# Altium schematic sheet 00_TOP_LEVEL.SchDoc
size A3
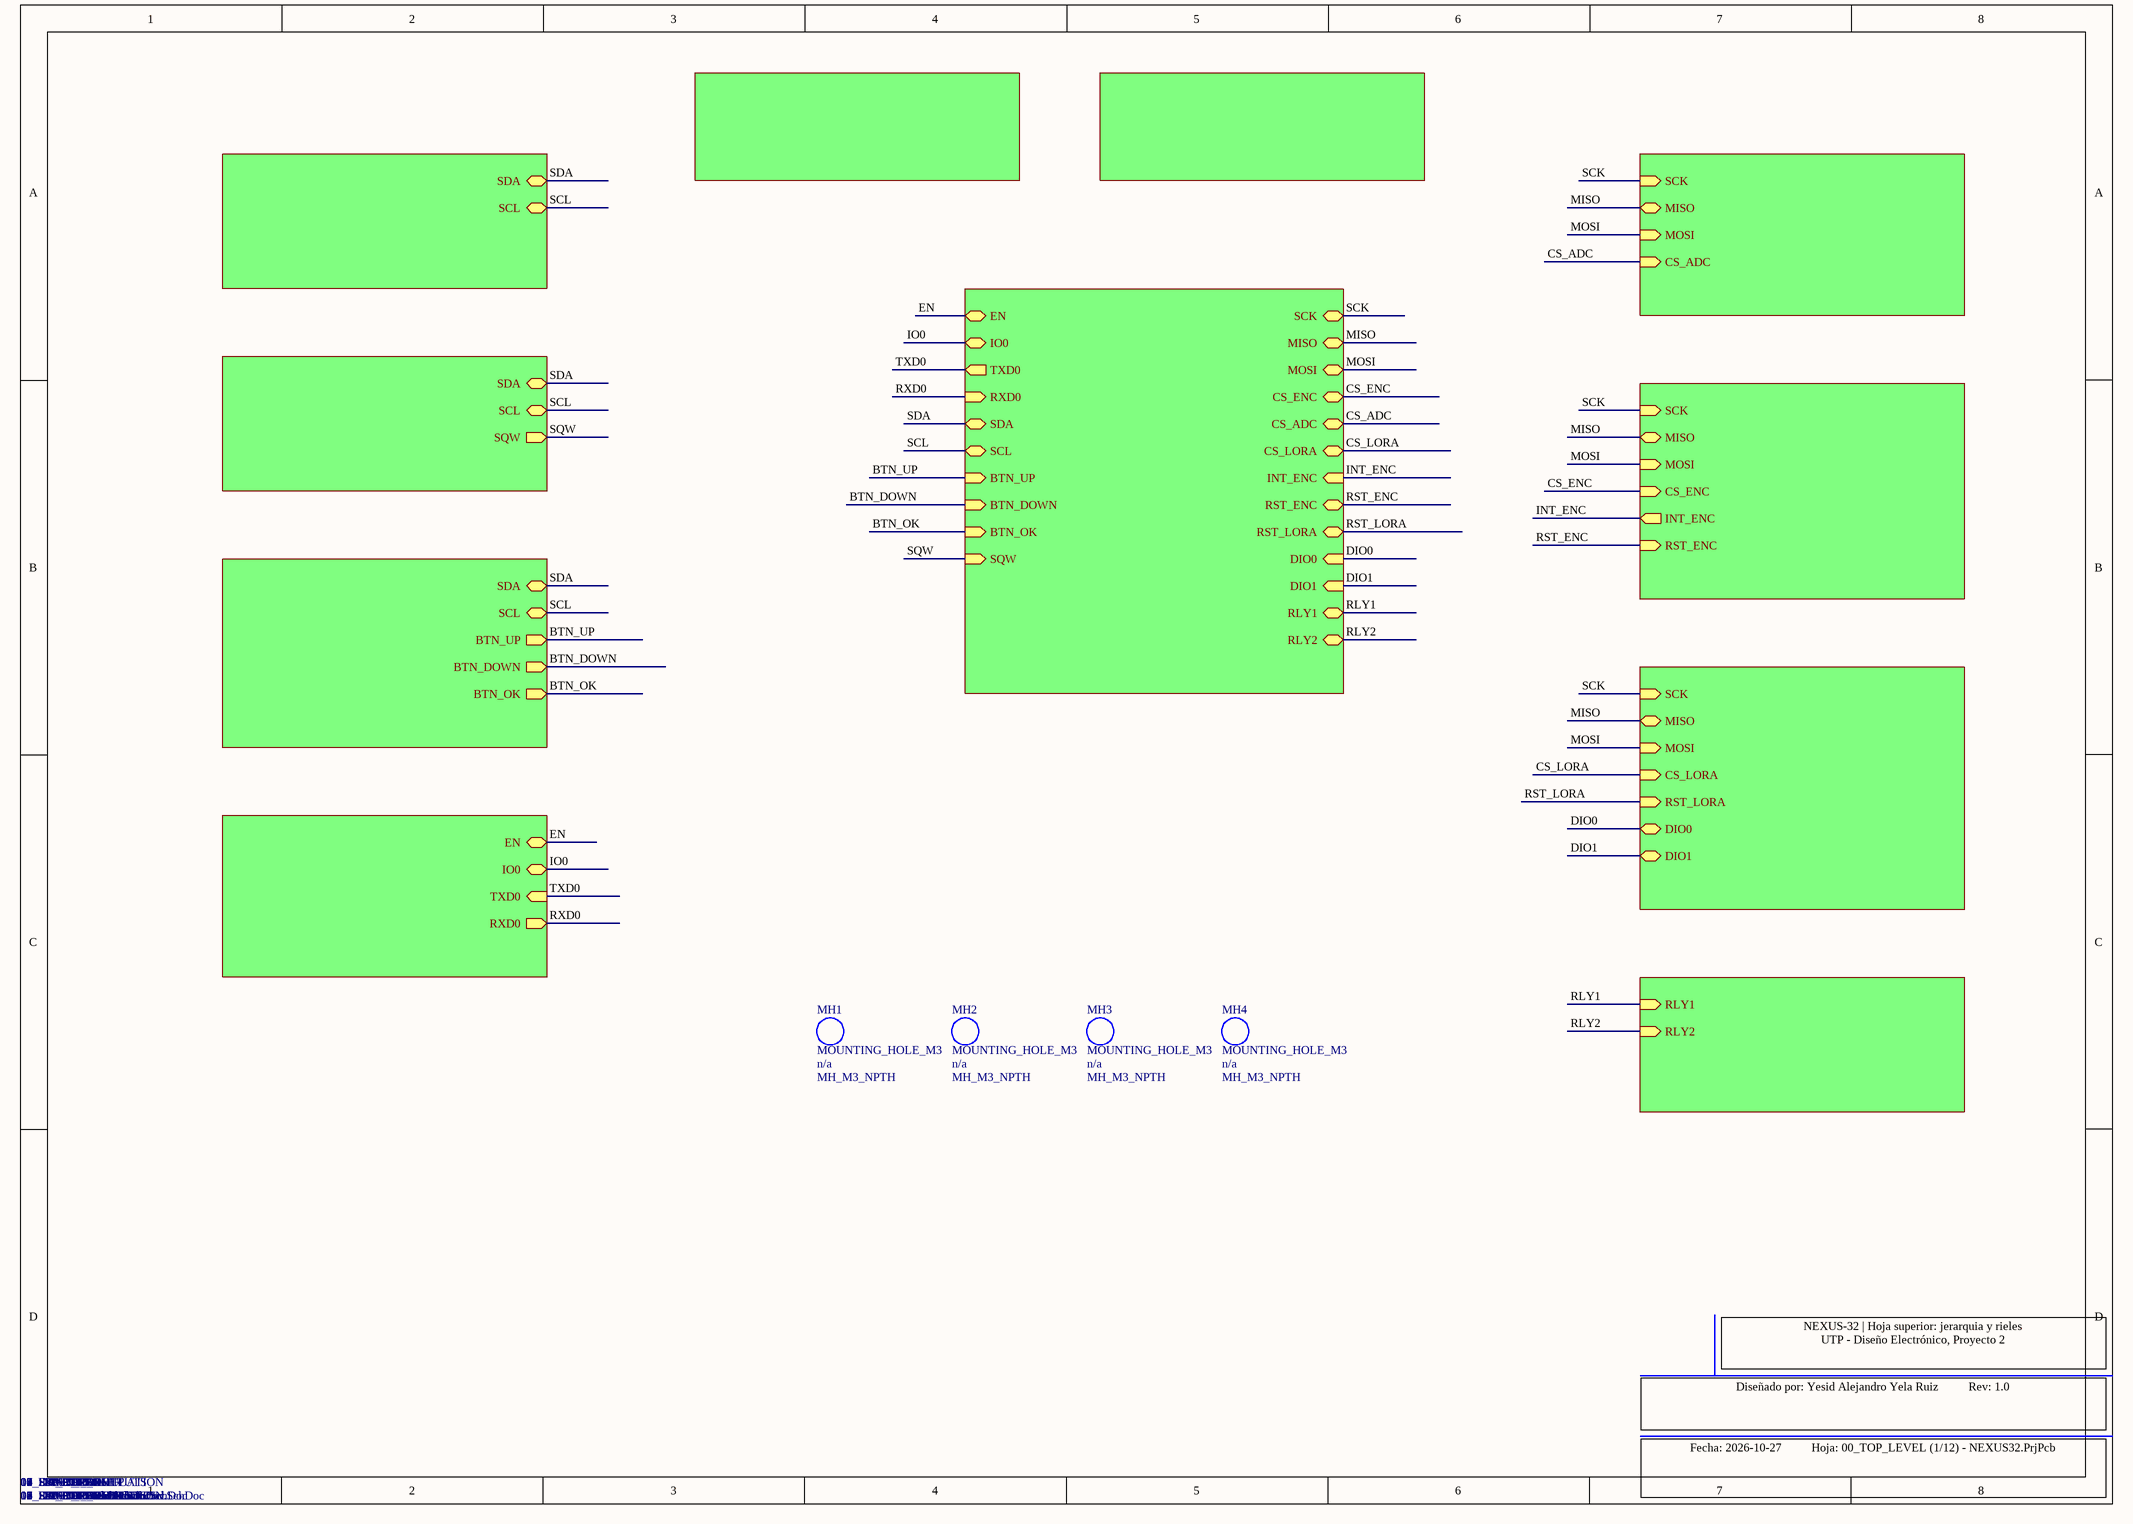
[diagram p0: 00_TOP_LEVEL.SchDoc]

## Parts
MH1  MOUNTING_HOLE_M3  Manufacturer Part Number: MH_M3_NPTH  [MH_M3]
MH2  MOUNTING_HOLE_M3  Manufacturer Part Number: MH_M3_NPTH  [MH_M3]
MH3  MOUNTING_HOLE_M3  Manufacturer Part Number: MH_M3_NPTH  [MH_M3]
MH4  MOUNTING_HOLE_M3  Manufacturer Part Number: MH_M3_NPTH  [MH_M3]

## Sub-sheets
01_INPUT_POWER = 01_INPUT_POWER.SchDoc: no entries
02_POWER_REGULATION = 02_POWER_REGULATION.SchDoc: no entries
03_ESP32_CORE = 03_ESP32_CORE.SchDoc: EN (bidir), IO0 (bidir), TXD0 (out), RXD0 (in), SDA (bidir), SCL (bidir), BTN_UP (in), BTN_DOWN (in), BTN_OK (in), SQW (in), SCK (bidir), MISO (bidir), MOSI (bidir), CS_ENC (bidir), CS_ADC (bidir), CS_LORA (bidir), INT_ENC (in), RST_ENC (bidir), RST_LORA (bidir), DIO0 (in), DIO1 (in), RLY1 (bidir), RLY2 (bidir)
04_I2C_EEPROM = 04_I2C_EEPROM.SchDoc: SDA (bidir), SCL (bidir)
05_I2C_RTC = 05_I2C_RTC.SchDoc: SDA (bidir), SCL (bidir), SQW (out)
06_I2C_OLED = 06_I2C_OLED.SchDoc: SDA (bidir), SCL (bidir), BTN_UP (out), BTN_DOWN (out), BTN_OK (out)
07_SPI_ADC = 07_SPI_ADC.SchDoc: SCK (in), MISO (bidir), MOSI (in), CS_ADC (in)
08_SPI_ETHERNET = 08_SPI_ETHERNET.SchDoc: SCK (in), MISO (bidir), MOSI (in), CS_ENC (in), INT_ENC (out), RST_ENC (in)
09_SPI_LORA = 09_SPI_LORA.SchDoc: SCK (in), MISO (bidir), MOSI (in), CS_LORA (in), RST_LORA (in), DIO0 (bidir), DIO1 (bidir)
10_UART_USB = 10_UART_USB.SchDoc: EN (bidir), IO0 (bidir), TXD0 (in), RXD0 (out)
11_DIGITAL_OUTPUTS = 11_DIGITAL_OUTPUTS.SchDoc: RLY1 (in), RLY2 (in)

## Nets
BTN_DOWN: sheet 03_ESP32_CORE/BTN_DOWN, sheet 06_I2C_OLED/BTN_DOWN
BTN_OK: sheet 03_ESP32_CORE/BTN_OK, sheet 06_I2C_OLED/BTN_OK
BTN_UP: sheet 03_ESP32_CORE/BTN_UP, sheet 06_I2C_OLED/BTN_UP
CS_ADC: sheet 03_ESP32_CORE/CS_ADC, sheet 07_SPI_ADC/CS_ADC
CS_ENC: sheet 03_ESP32_CORE/CS_ENC, sheet 08_SPI_ETHERNET/CS_ENC
CS_LORA: sheet 03_ESP32_CORE/CS_LORA, sheet 09_SPI_LORA/CS_LORA
DIO0: sheet 03_ESP32_CORE/DIO0, sheet 09_SPI_LORA/DIO0
DIO1: sheet 03_ESP32_CORE/DIO1, sheet 09_SPI_LORA/DIO1
EN: sheet 03_ESP32_CORE/EN, sheet 10_UART_USB/EN
INT_ENC: sheet 03_ESP32_CORE/INT_ENC, sheet 08_SPI_ETHERNET/INT_ENC
IO0: sheet 03_ESP32_CORE/IO0, sheet 10_UART_USB/IO0
MISO: sheet 03_ESP32_CORE/MISO, sheet 07_SPI_ADC/MISO, sheet 08_SPI_ETHERNET/MISO, sheet 09_SPI_LORA/MISO
MOSI: sheet 03_ESP32_CORE/MOSI, sheet 07_SPI_ADC/MOSI, sheet 08_SPI_ETHERNET/MOSI, sheet 09_SPI_LORA/MOSI
RLY1: sheet 03_ESP32_CORE/RLY1, sheet 11_DIGITAL_OUTPUTS/RLY1
RLY2: sheet 03_ESP32_CORE/RLY2, sheet 11_DIGITAL_OUTPUTS/RLY2
RST_ENC: sheet 03_ESP32_CORE/RST_ENC, sheet 08_SPI_ETHERNET/RST_ENC
RST_LORA: sheet 03_ESP32_CORE/RST_LORA, sheet 09_SPI_LORA/RST_LORA
RXD0: sheet 03_ESP32_CORE/RXD0, sheet 10_UART_USB/RXD0
SCK: sheet 03_ESP32_CORE/SCK, sheet 07_SPI_ADC/SCK, sheet 08_SPI_ETHERNET/SCK, sheet 09_SPI_LORA/SCK
SCL: sheet 03_ESP32_CORE/SCL, sheet 04_I2C_EEPROM/SCL, sheet 05_I2C_RTC/SCL, sheet 06_I2C_OLED/SCL
SDA: sheet 03_ESP32_CORE/SDA, sheet 04_I2C_EEPROM/SDA, sheet 05_I2C_RTC/SDA, sheet 06_I2C_OLED/SDA
SQW: sheet 03_ESP32_CORE/SQW, sheet 05_I2C_RTC/SQW
TXD0: sheet 03_ESP32_CORE/TXD0, sheet 10_UART_USB/TXD0

## Notes on the sheet
- NEXUS-32 | Hoja superior: jerarquia y rieles
  UTP - Diseño Electrónico, Proyecto 2
- Diseñado por: Yesid Alejandro Yela Ruiz          Rev: 1.0
- Fecha: 2026-10-27          Hoja: 00_TOP_LEVEL (1/12) - NEXUS32.PrjPcb

## Library data of the parts
MH1-MH4 = MOUNTING_HOLE_M3: Agujero de montaje M3 NPTH (sin pines, sin red); Manufacturer: n/a